# Altium schematic sheet CONN.schdoc
size 297 x 209 mm; Symbol: Drawing-Symbol_A4; Company: 上海道尔汇控智能科技有限公司; Version: V1.2; Page Size: A4; @Project Name: YTM32; @Page Count: 5; @Update Date: 2025-12-22; @Create Date: 2025-10-25; @Schematic Name: YTM32_MotorControl; @Page No: 5; @Page Name: CONN; @Create Time: 03:22:35; @Update Time: 01:04:27; Border: 1; Width: 1170; Height: 825; Region Start: 1; X Region Count: 6; Y Region Count: 4; Blade Width: 10; Title Block Position: 3; @Board Name: YTM32_MotorControl; Device: Drawing-Symbol_A4
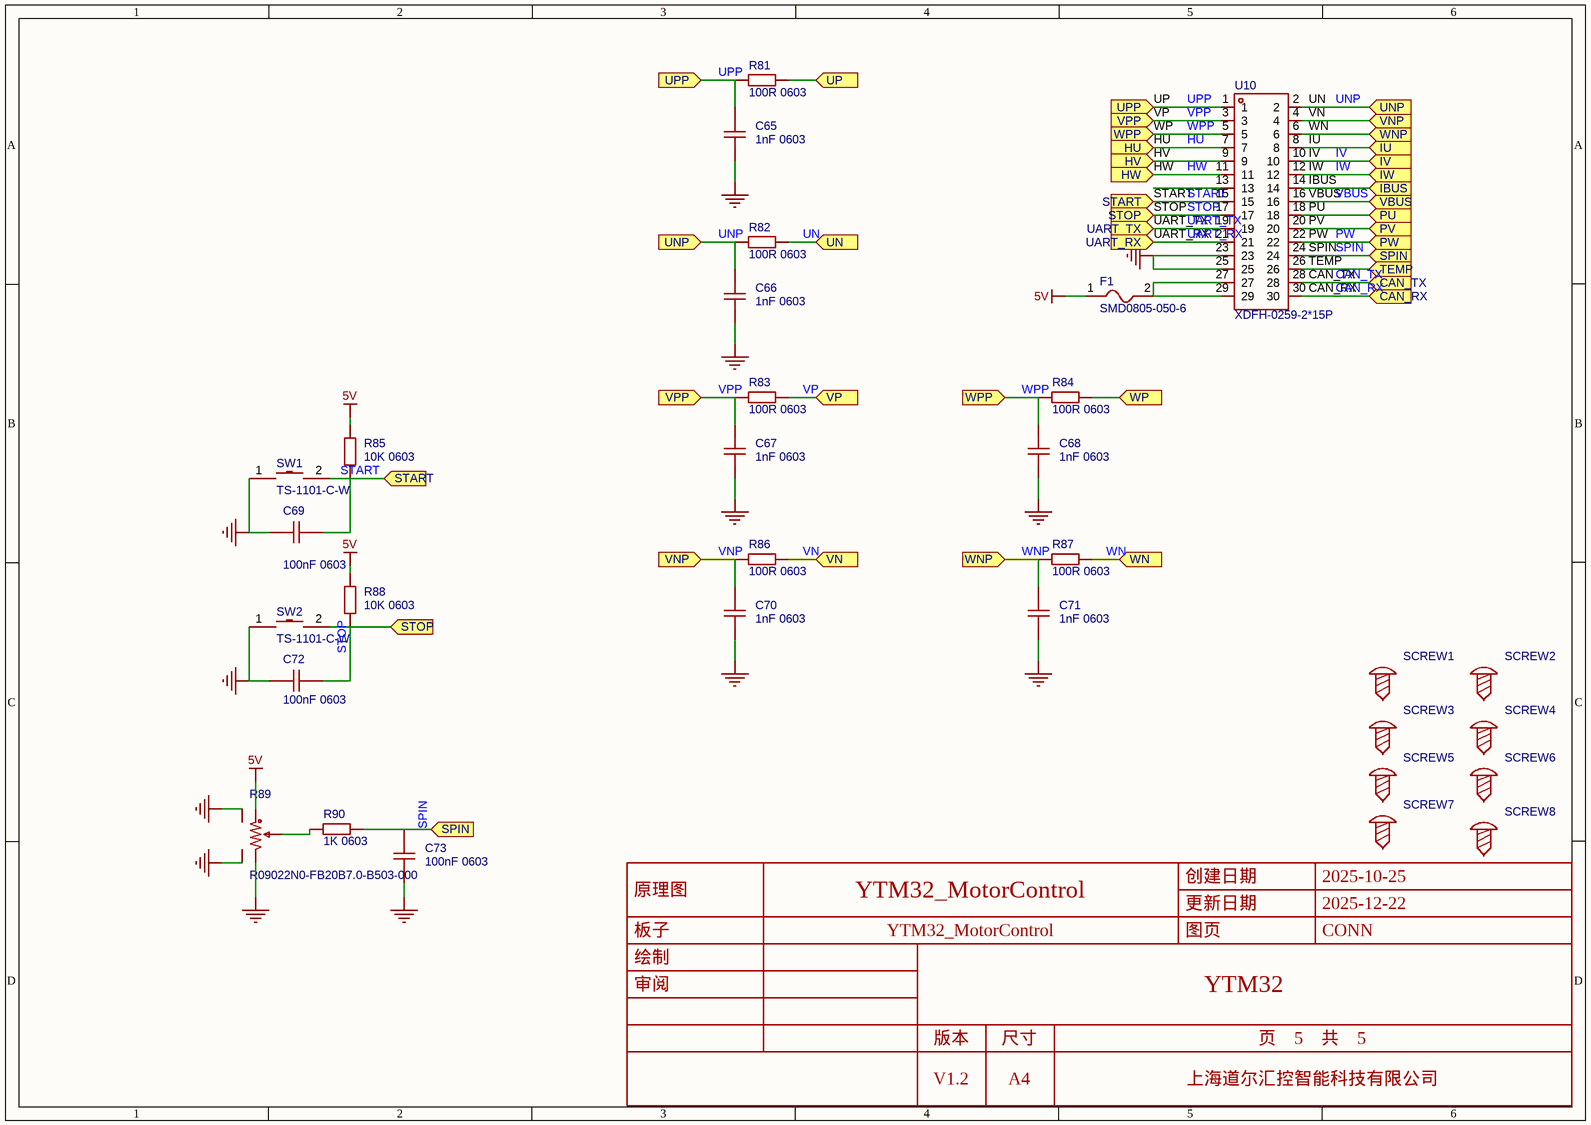
[diagram p0: CONN.schdoc]

## Parts
C65  1nF 0603  [C0603]
C66  1nF 0603  [C0603]
C67  1nF 0603  [C0603]
C68  1nF 0603  [C0603]
C69  100nF 0603  [C0603]
C70  1nF 0603  [C0603]
C71  1nF 0603  [C0603]
C72  100nF 0603  [C0603]
C73  100nF 0603  [C0603]
F1  SMD0805-050-6  [F0805]
R81  100R 0603  [R0603]
R82  100R 0603  [R0603]
R83  100R 0603  [R0603]
R84  100R 0603  [R0603]
R85  10K 0603  [R0603]
R86  100R 0603  [R0603]
R87  100R 0603  [R0603]
R88  10K 0603  [R0603]
R89  R09022N0-FB20B7.0-B503-000  [RES-ADJ-TH_R09022N0-FB20B7B503-0004]
R90  1K 0603  [R0603]
SCREW1  (no value)  [M3螺丝]
SCREW2  (no value)  [M3螺丝]
SCREW3  (no value)  [M3螺丝]
SCREW4  (no value)  [M3螺丝]
SCREW5  (no value)  [M3螺丝]
SCREW6  (no value)  [M3螺丝]
SCREW7  (no value)  [M3螺丝]
SCREW8  (no value)  [M3螺丝]
SW1  TS-1101-C-W  [SW-SMD_L6.0-W3.3-LS8.0]
SW2  TS-1101-C-W  [SW-SMD_L6.0-W3.3-LS8.0]
U10  XDFH-0259-2*15P  [CONN-TH_30P-P2.54_LX_XDFH-0259-2X15P]

## Ports
CAN_RX (in), CAN_TX (in), HU (in), HV (in), HW (in), IBUS (in), IU (in), IV (in), IW (in), PU (in), PV (in), PW (in), SPIN (in), START (in), STOP (in), TEMP (in), UART_RX (in), UART_TX (in), UN (in), UNP (in), UP (in), UPP (in), VBUS (in), VN (in), VNP (in), VP (in), VPP (in), WN (in), WNP (in), WP (in), WPP (in)

## Nets
5V: F1.1 R85.2 R88.2 R89.1
GND: C65.2 C66.2 C67.2 C68.2 C69.2 C70.2 C71.2 C72.2 C73.2 R89.3 R89.4 R89.5 SW1.1 SW2.1 U10.23 U10.25
CAN_RX: U10.30 ; port CAN_RX
CAN_TX: U10.28 ; port CAN_TX
HU: U10.7 ; port HU
HV: U10.9 ; port HV
HW: U10.11 ; port HW
IBUS: U10.14 ; port IBUS
IU: U10.8 ; port IU
IV: U10.10 ; port IV
IW: U10.12 ; port IW
PU: U10.18 ; port PU
PV: U10.20 ; port PV
PW: U10.22 ; port PW
SPIN: C73.1 R90.1 U10.24 ; port SPIN
START: C69.1 R85.1 SW1.2 U10.15 ; port START
STOP: C72.1 R88.1 SW2.2 U10.17 ; port STOP
TEMP: U10.26 ; port TEMP
UART_RX: U10.21 ; port UART_RX
UART_TX: U10.19 ; port UART_TX
UN: R82.1 ; port UN
UNP: C66.1 R82.2 U10.2 ; port UNP
UP: R81.1 ; port UP
UPP: C65.1 R81.2 U10.1 ; port UPP
VBUS: U10.16 ; port VBUS
VN: R86.1 ; port VN
VNP: C70.1 R86.2 U10.4 ; port VNP
VP: R83.1 ; port VP
VPP: C67.1 R83.2 U10.3 ; port VPP
WN: R87.1 ; port WN
WNP: C71.1 R87.2 U10.6 ; port WNP
WP: R84.1 ; port WP
WPP: C68.1 R84.2 U10.5 ; port WPP
NetF1_2: F1.2 U10.27 U10.29
NetR89_2: R89.2 R90.2

Not connected (* = marked no-connect by the designer): SCREW1 1; SCREW2 1; SCREW3 1; SCREW4 1; SCREW5 1; SCREW6 1; SCREW7 1; SCREW8 1; U10 13

## Notes on the sheet
- UP
- VP
- WP
- (near U10) UN
- (near U10) VN
- (near U10) WN
- HU
- HV
- HW
- (near U10) START
- (near U10) IU
- (near U10) IV
- (near U10) IW
- (near U10) IBUS
- (near U10) VBUS
- STOP
- (near U10) UART_TX
- UART_RX
- (near U10) PU
- (near U10) PV
- (near U10) PW
- (near U10) SPIN
- (near U10) TEMP
- (near U10) CAN_TX
- (near U10) CAN_RX
- 创建日期
- 2025-10-25
- 原理图
- 板子
- YTM32_MotorControl
- 更新日期
- 图页
- 2025-12-22
- CONN
- 绘制
- 审阅
- YTM32
- 版本
- V1.2
- 尺寸
- A4
- 页    5    共    5
- 上海道尔汇控智能科技有限公司

## Library data of the parts
C65-C73 = CAP_0603: ConvertToPcb: yes; SymbolName: CapAcitance; ModelId: ac125912035d415993ca9572d50418b1; ModelName: C0603_L1.6-W0.8-H0.8; ModelTransform: 62.992,31.496,0,0,0,0,0,0,0; Device: CAP_0603; AddInBom: yes; Supplier Footprint: 0603; FootprintName: C0603
  C65-C68 C70 C71: Value: 1nF 0603
  C69 C72 C73: Value: 100nF 0603
F1 = SMD0805-050-6: 耐压(Vmax):6V;最大电流(Imax):40A;保持电流(Ihold):500mA;跳闸电流(Itrip):1A;; Manufacturer: R+O(宏嘉诚); AddInBom: yes; ModelId: 57e2aa106f9143e8b6ab832aebb31c78; ModelName: F0805_L2.1-W1.4-H0.8; ModelTransform: 82.677,55.118,0,0,0,0,0.0005,0,0; Voltage - Max: 6V; Current - Max: 40A; Hold Current: 500mA; Trip Current: 1A; Power Dissipation: 500mW; Resistance - Initial (Ri) (Min): 100mΩ; Resistance - Post Trip (R1) (Max): 850mΩ; Time to Trip(Max): 100ms; Symbol: SMD0805-050-6; Device: SMD0805-050-6; LCSC Part Name: SMD0805-050-6; SupplierPart: C46640983; ManufacturerPart: SMD0805-050-6; Supplier Footprint: 0805; JLCPCB Part Class: 扩展库; Datasheet: https://item.szlcsc.com/datasheet/SMD0805-050-6/48798689.html; Supplier: LCSC; ConvertToPcb: yes; FootprintName: F0805; Operating Temperature: -40℃~+85℃; Length: 2.2mm; Width: 1.5mm; Height: 0.8mm
R81-R88 R90 = Res_0603: Symbol: 电阻; ConvertToPcb: yes; ModelId: fc143cca1e79419f9cd78b61e9279f08; ModelTransform: 31.8897,63.7794,0,90,0,0,0,0,0; Device: Res_0603; AddInBom: yes; Supplier Footprint: 0603; FootprintName: R0603; ModelName: R0603
  R81-R84 R86 R87: Value: 100R 0603
  R85 R88: Value: 10K 0603
  R90: Value: 1K 0603
R89 = R09022N0-FB20B7.0-B503-000: 可调电阻旋转电位器; Manufacturer: CTR(长泰尔电子); AddInBom: yes; ModelId: 71d2ca23f0844f7d968f95a814dfb0e2; ModelTransform: 450.24737,500.038,0,0,0,0,0,104.055,-149.606; Voltage Rating: 10V; Symbol: R09022N0-FB20B7.0-B503-000; Device: R09022N0-FB20B7.0-B503-000; LCSC Part Name: R09022N0-FB20B7.0-B503-000; SupplierPart: C18213417; ManufacturerPart: R09022N0-FB20B7.0-B503-000; Supplier Footprint: 插件; JLCPCB Part Class: 扩展库; Datasheet: https://atta.szlcsc.com/upload/public/pdf/source/20231010/93ED3CE9FDD6AC93F067D89ACCCFD006.pdf; Supplier: LCSC; ConvertToPcb: yes; FootprintName: RES-ADJ-TH_R09022N0-FB20B7B503-0004; ModelName: RES-ADJ-TH_R09022N0-FB20B7B503-0004
SCREW1-SCREW8 = M3螺丝: ConvertToPcb: yes; SymbolName: 螺丝孔; Device: M3螺丝; AddInBom: yes; Supplier Footprint: 插件; FootprintName: M3螺丝
SW1 SW2 = TS-1101-C-W: 电路结构:单刀单掷;按钮形状:矩形按钮;作用力:260gf;安装方式:立贴;开关长度:6mm;开关宽度:3.6mm;开关高度:2.5mm;带支架:不带;触点电流:50mA;额定电压(AC):-;额定电压(DC):12V;额定功率:-;绝缘电阻:-;带灯:无;机械寿命:5万次;; Manufacturer: XKB Connectivity(中国星坤); AddInBom: yes; ModelId: b2f4ea9f0afc4b0786d53dba66ceb9e4; ModelName: SW-SMD_L6.0-W3.3-H5-LS8.0; ModelTransform: 314.96,129.921,0,0,0,0,0,0,0; Circuit: 单刀单掷; Actuator Style: 矩形按钮; Operating Force: 260gf; Switch Length: 6mm; Switch Width: 3.6mm; Switch Height: 2.5mm; Strike Gundam: 不带; Contact Current: 50mA; Voltage Rating (DC): 12V; Actuator/Cap Color: 白色带淡绿; With Lamp: 无; Mechanical Life: 5万次; Symbol: TS-1101-C-W; Device: TS-1101-C-W; LCSC Part Name: 6*3.6*2.5mm 立贴 轻触开关; SupplierPart: C318938; ManufacturerPart: TS-1101-C-W; Supplier Footprint: SMD; JLCPCB Part Class: 扩展库; Datasheet: https://atta.szlcsc.com/upload/public/pdf/source/20200227/C318938_C2E53B1EEDE37D980A33616AC086DE53.pdf; Supplier: LCSC; ConvertToPcb: yes; FootprintName: SW-SMD_L6.0-W3.3-LS8.0; Mounting Style: 立贴; Voltage Rating (AC): -; Power Rating: -; Insulation Resistance: -; IP Rating: -; Pin Style: -; Operating Temperature: -30℃~+85℃
U10 = XDFH-0259-2*15P: 连接器类型:简牛座;间距:2.54mm;结构:2x15P;额定电流:3A;额定电压:500V;封装形式:弯插;排数:2;每排PIN数:15;触头材质:铜;触头镀层:金;工作温度范围:-45℃~+105℃;; Manufacturer: LX(连欣科技); AddInBom: yes; ModelId: 5c3b8136d5a14d27ae11c9ec27ec7f0d; ModelTransform: 1799.209,492.9124,0,0,0,0,0,185.039,-129.921; Connector Type: 简牛座; Pitch: 2.54mm; Number of Positions or Pins: 2x15P; Current Rating: 3A; Voltage Rating (Max): 500V; Holder Type: 弯插; Number of PINs Per Row: 15; Symbol: XDFH-0259-2*15P; Device: XDFH-0259-2*15P; LCSC Part Name: 2U镀金PH2.54MM-2*15PIN卧插简牛插座专用; SupplierPart: C19193828; ManufacturerPart: XDFH-0259-2*15P; Supplier Footprint: 弯插,P=2.54mm; JLCPCB Part Class: 扩展库; Datasheet: https://atta.szlcsc.com/upload/public/pdf/source/20231117/460E6BB7C0FB7D45FB9AB0ED1A0F90C2.pdf; Supplier: LCSC; ConvertToPcb: yes; FootprintName: CONN-TH_30P-P2.54_LX_XDFH-0259-2X15P; ModelName: CONN-TH_30P-P2.54_LX_XDFH-0259-2X15P; Number of Rows: 2; Contact Material: 铜; Contact Plating: 金; Operating Temperature: -45℃~+105℃